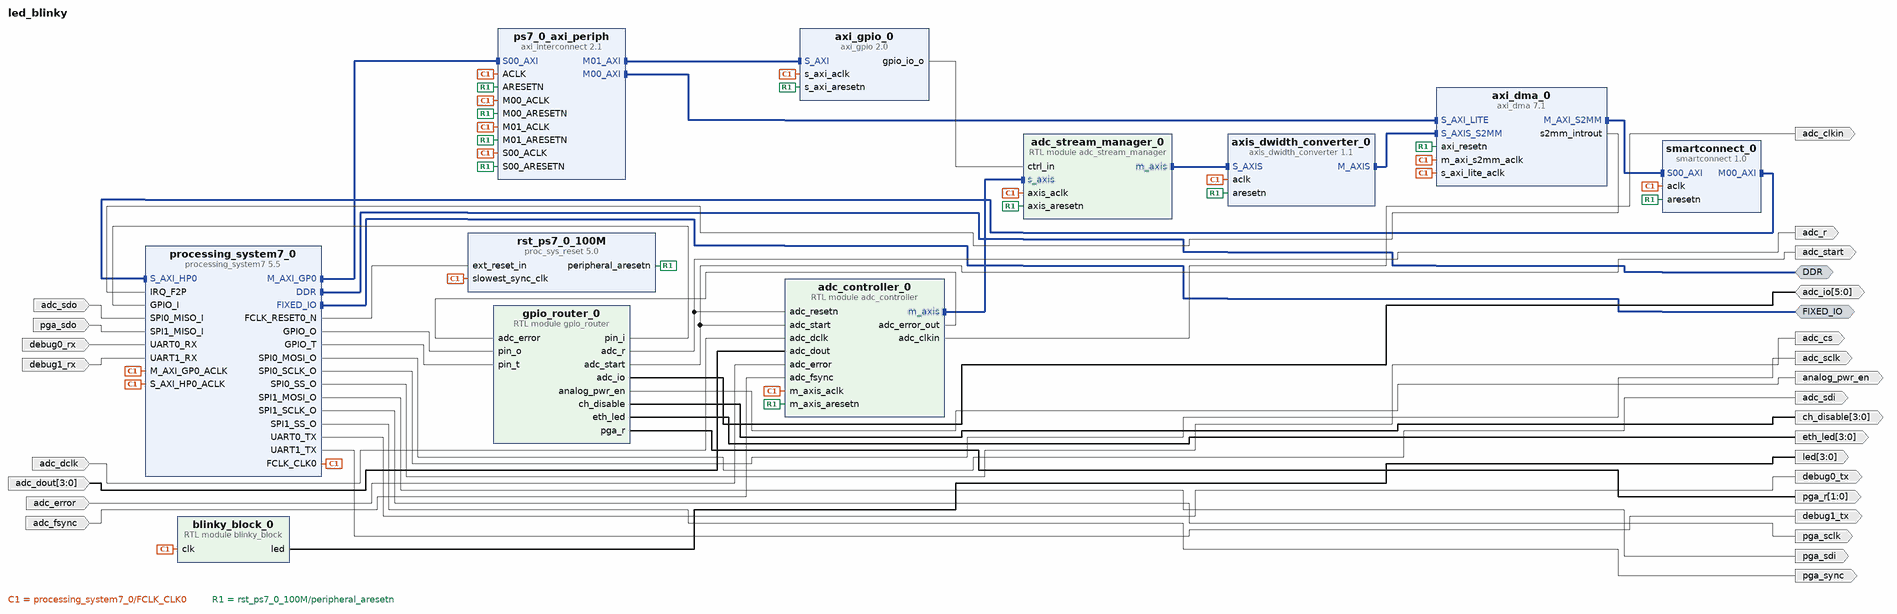
[diagram p0: block diagram of the top level]
# Vivado block design led_blinky, xc7z020clg484-2, Vivado 2022.2
create_bd_design led_blinky

create_bd_intf_port -mode Master -vlnv xilinx.com:interface:ddrx_rtl:1.0 DDR
create_bd_intf_port -mode Master -vlnv xilinx.com:display_processing_system7:fixedio_rtl:1.0 FIXED_IO
create_bd_port -dir O -from 3 -to 0 led
create_bd_port -dir O debug0_tx
create_bd_port -dir I debug0_rx
create_bd_port -dir O debug1_tx
create_bd_port -dir I debug1_rx
create_bd_port -dir O -from 3 -to 0 eth_led
create_bd_port -dir O analog_pwr_en
create_bd_port -dir O -from 3 -to 0 ch_disable
create_bd_port -dir IO -from 5 -to 0 adc_io
create_bd_port -dir O -from 1 -to 0 pga_r
create_bd_port -dir O adc_sclk
create_bd_port -dir O adc_sdi
create_bd_port -dir I adc_sdo
create_bd_port -dir O adc_cs
create_bd_port -dir O pga_sclk
create_bd_port -dir O pga_sdi
create_bd_port -dir I pga_sdo
create_bd_port -dir O pga_sync
create_bd_port -dir O -type clk adc_clkin
create_bd_port -dir O adc_start
create_bd_port -dir O adc_r
create_bd_port -dir I adc_error
create_bd_port -dir I adc_fsync
create_bd_port -dir I -from 3 -to 0 adc_dout
create_bd_port -dir I adc_dclk

create_bd_cell -type module -reference blinky_block blinky_block_0
create_bd_cell -type ip -vlnv xilinx.com:ip:processing_system7:5.5 processing_system7_0
set_property -dict [list \
  CONFIG.PCW_ENET0_ENET0_IO {MIO 16 .. 27} \
  CONFIG.PCW_ENET0_GRP_MDIO_ENABLE 1 \
  CONFIG.PCW_ENET0_GRP_MDIO_IO {MIO 52 .. 53} \
  CONFIG.PCW_ENET0_PERIPHERAL_ENABLE 1 \
  CONFIG.PCW_ENET_RESET_ENABLE 0 \
  CONFIG.PCW_FPGA0_PERIPHERAL_FREQMHZ 100 \
  CONFIG.PCW_GPIO_EMIO_GPIO_ENABLE 1 \
  CONFIG.PCW_GPIO_EMIO_GPIO_IO 64 \
  CONFIG.PCW_GPIO_MIO_GPIO_ENABLE 1 \
  CONFIG.PCW_GPIO_MIO_GPIO_IO MIO \
  CONFIG.PCW_I2C_RESET_ENABLE 0 \
  CONFIG.PCW_IRQ_F2P_INTR 1 \
  CONFIG.PCW_PRESET_BANK1_VOLTAGE {LVCMOS 1.8V} \
  CONFIG.PCW_QSPI_GRP_FBCLK_ENABLE 1 \
  CONFIG.PCW_QSPI_GRP_FBCLK_IO {MIO 8} \
  CONFIG.PCW_QSPI_GRP_SINGLE_SS_ENABLE 1 \
  CONFIG.PCW_QSPI_GRP_SINGLE_SS_IO {MIO 1 .. 6} \
  CONFIG.PCW_QSPI_PERIPHERAL_ENABLE 1 \
  CONFIG.PCW_QSPI_QSPI_IO {MIO 1 .. 6} \
  CONFIG.PCW_SD0_PERIPHERAL_ENABLE 0 \
  CONFIG.PCW_SINGLE_QSPI_DATA_MODE x4 \
  CONFIG.PCW_SPI0_PERIPHERAL_ENABLE 1 \
  CONFIG.PCW_SPI0_SPI0_IO EMIO \
  CONFIG.PCW_SPI1_PERIPHERAL_ENABLE 1 \
  CONFIG.PCW_SPI1_SPI1_IO EMIO \
  CONFIG.PCW_UART0_PERIPHERAL_ENABLE 1 \
  CONFIG.PCW_UART0_UART0_IO EMIO \
  CONFIG.PCW_UART1_PERIPHERAL_ENABLE 1 \
  CONFIG.PCW_UART1_UART1_IO EMIO \
  CONFIG.PCW_UART_PERIPHERAL_FREQMHZ 100 \
  CONFIG.PCW_UIPARAM_DDR_PARTNO {MT41J256M16 RE-125} \
  CONFIG.PCW_USB0_PERIPHERAL_ENABLE 1 \
  CONFIG.PCW_USB0_USB0_IO {MIO 28 .. 39} \
  CONFIG.PCW_USB_RESET_ENABLE 0 \
  CONFIG.PCW_USE_FABRIC_INTERRUPT 1 \
  CONFIG.PCW_USE_S_AXI_HP0 1 \
] [get_bd_cells processing_system7_0]
# 238 more settings of processing_system7_0 are not shown: defaults, MIO pin electricals, DDR timing, and values the tool derives
create_bd_cell -type ip -vlnv xilinx.com:ip:axis_dwidth_converter:1.1 axis_dwidth_converter_0
set_property -dict {CONFIG.M_TDATA_NUM_BYTES 8 CONFIG.S_TDATA_NUM_BYTES 16} [get_bd_cells axis_dwidth_converter_0]
create_bd_cell -type ip -vlnv xilinx.com:ip:axi_interconnect:2.1 ps7_0_axi_periph
set_property -dict {CONFIG.NUM_MI 2} [get_bd_cells ps7_0_axi_periph]
create_bd_cell -type ip -vlnv xilinx.com:ip:smartconnect:1.0 smartconnect_0
set_property -dict {CONFIG.NUM_SI 1} [get_bd_cells smartconnect_0]
create_bd_cell -type ip -vlnv xilinx.com:ip:proc_sys_reset:5.0 rst_ps7_0_100M
create_bd_cell -type module -reference gpio_router gpio_router_0
create_bd_cell -type ip -vlnv xilinx.com:ip:axi_gpio:2.0 axi_gpio_0
set_property -dict {CONFIG.C_ALL_OUTPUTS 1 CONFIG.C_DOUT_DEFAULT 0x00000080 CONFIG.C_GPIO_WIDTH 16} [get_bd_cells axi_gpio_0]
create_bd_cell -type module -reference adc_controller adc_controller_0
create_bd_cell -type module -reference adc_stream_manager adc_stream_manager_0
create_bd_cell -type ip -vlnv xilinx.com:ip:axi_dma:7.1 axi_dma_0
set_property -dict [list \
  CONFIG.c_include_mm2s 0 \
  CONFIG.c_include_sg 0 \
  CONFIG.c_m_axi_s2mm_data_width 64 \
  CONFIG.c_s_axis_s2mm_tdata_width 64 \
] [get_bd_cells axi_dma_0]

# ---- connections ----

connect_bd_intf_net [get_bd_intf_pins adc_stream_manager_0/s_axis] [get_bd_intf_pins adc_controller_0/m_axis]
connect_bd_intf_net [get_bd_intf_pins adc_stream_manager_0/m_axis] [get_bd_intf_pins axis_dwidth_converter_0/S_AXIS]
connect_bd_intf_net [get_bd_intf_pins axi_dma_0/M_AXI_S2MM] [get_bd_intf_pins smartconnect_0/S00_AXI]
connect_bd_intf_net [get_bd_intf_pins axis_dwidth_converter_0/M_AXIS] [get_bd_intf_pins axi_dma_0/S_AXIS_S2MM]
connect_bd_intf_net [get_bd_intf_ports DDR] [get_bd_intf_pins processing_system7_0/DDR]
connect_bd_intf_net [get_bd_intf_ports FIXED_IO] [get_bd_intf_pins processing_system7_0/FIXED_IO]
connect_bd_intf_net [get_bd_intf_pins ps7_0_axi_periph/S00_AXI] [get_bd_intf_pins processing_system7_0/M_AXI_GP0]
connect_bd_intf_net [get_bd_intf_pins ps7_0_axi_periph/M00_AXI] [get_bd_intf_pins axi_dma_0/S_AXI_LITE]
connect_bd_intf_net [get_bd_intf_pins ps7_0_axi_periph/M01_AXI] [get_bd_intf_pins axi_gpio_0/S_AXI]
connect_bd_intf_net [get_bd_intf_pins smartconnect_0/M00_AXI] [get_bd_intf_pins processing_system7_0/S_AXI_HP0]
connect_bd_net -net SPI0_MISO_I_0_1 [get_bd_ports adc_sdo] [get_bd_pins processing_system7_0/SPI0_MISO_I]
connect_bd_net -net SPI1_MISO_I_0_1 [get_bd_ports pga_sdo] [get_bd_pins processing_system7_0/SPI1_MISO_I]
connect_bd_net -net UART0_RX_0_1 [get_bd_ports debug0_rx] [get_bd_pins processing_system7_0/UART0_RX]
connect_bd_net -net UART1_RX_0_1 [get_bd_ports debug1_rx] [get_bd_pins processing_system7_0/UART1_RX]
connect_bd_net [get_bd_pins adc_controller_0/adc_clkin] [get_bd_ports adc_clkin]
connect_bd_net [get_bd_pins adc_controller_0/adc_error_out] [get_bd_pins gpio_router_0/adc_error]
connect_bd_net [get_bd_ports adc_dclk] [get_bd_pins adc_controller_0/adc_dclk]
connect_bd_net -net adc_dout_0_1 [get_bd_ports adc_dout] [get_bd_pins adc_controller_0/adc_dout]
connect_bd_net -net adc_error_0_1 [get_bd_ports adc_error] [get_bd_pins adc_controller_0/adc_error]
connect_bd_net [get_bd_ports adc_fsync] [get_bd_pins adc_controller_0/adc_fsync]
connect_bd_net [get_bd_ports adc_io] [get_bd_pins gpio_router_0/adc_io]
connect_bd_net [get_bd_pins axi_dma_0/s2mm_introut] [get_bd_pins processing_system7_0/IRQ_F2P]
connect_bd_net [get_bd_pins axi_gpio_0/gpio_io_o] [get_bd_pins adc_stream_manager_0/ctrl_in]
connect_bd_net [get_bd_pins blinky_block_0/led] [get_bd_ports led]
connect_bd_net [get_bd_pins gpio_router_0/adc_r] [get_bd_ports adc_r] [get_bd_pins adc_controller_0/adc_resetn]
connect_bd_net [get_bd_pins gpio_router_0/adc_start] [get_bd_ports adc_start] [get_bd_pins adc_controller_0/adc_start]
connect_bd_net [get_bd_pins gpio_router_0/analog_pwr_en] [get_bd_ports analog_pwr_en]
connect_bd_net [get_bd_pins gpio_router_0/ch_disable] [get_bd_ports ch_disable]
connect_bd_net [get_bd_pins gpio_router_0/eth_led] [get_bd_ports eth_led]
connect_bd_net [get_bd_pins gpio_router_0/pga_r] [get_bd_ports pga_r]
connect_bd_net [get_bd_pins gpio_router_0/pin_i] [get_bd_pins processing_system7_0/GPIO_I]
connect_bd_net [get_bd_pins processing_system7_0/FCLK_CLK0] \
  [get_bd_pins blinky_block_0/clk] [get_bd_pins ps7_0_axi_periph/S00_ACLK] [get_bd_pins ps7_0_axi_periph/M00_ACLK] \
  [get_bd_pins ps7_0_axi_periph/ACLK] [get_bd_pins rst_ps7_0_100M/slowest_sync_clk] [get_bd_pins smartconnect_0/aclk] \
  [get_bd_pins processing_system7_0/S_AXI_HP0_ACLK] [get_bd_pins axi_gpio_0/s_axi_aclk] \
  [get_bd_pins ps7_0_axi_periph/M01_ACLK] [get_bd_pins processing_system7_0/M_AXI_GP0_ACLK] \
  [get_bd_pins axis_dwidth_converter_0/aclk] [get_bd_pins adc_controller_0/m_axis_aclk] \
  [get_bd_pins adc_stream_manager_0/axis_aclk] [get_bd_pins axi_dma_0/m_axi_s2mm_aclk] \
  [get_bd_pins axi_dma_0/s_axi_lite_aclk]
connect_bd_net [get_bd_pins processing_system7_0/FCLK_RESET0_N] [get_bd_pins rst_ps7_0_100M/ext_reset_in]
connect_bd_net [get_bd_pins processing_system7_0/GPIO_O] [get_bd_pins gpio_router_0/pin_o]
connect_bd_net [get_bd_pins processing_system7_0/GPIO_T] [get_bd_pins gpio_router_0/pin_t]
connect_bd_net [get_bd_pins processing_system7_0/SPI0_MOSI_O] [get_bd_ports adc_sdi]
connect_bd_net [get_bd_pins processing_system7_0/SPI0_SCLK_O] [get_bd_ports adc_sclk]
connect_bd_net [get_bd_pins processing_system7_0/SPI0_SS_O] [get_bd_ports adc_cs]
connect_bd_net [get_bd_pins processing_system7_0/SPI1_MOSI_O] [get_bd_ports pga_sdi]
connect_bd_net [get_bd_pins processing_system7_0/SPI1_SCLK_O] [get_bd_ports pga_sclk]
connect_bd_net [get_bd_pins processing_system7_0/SPI1_SS_O] [get_bd_ports pga_sync]
connect_bd_net [get_bd_pins processing_system7_0/UART0_TX] [get_bd_ports debug0_tx]
connect_bd_net [get_bd_pins processing_system7_0/UART1_TX] [get_bd_ports debug1_tx]
connect_bd_net [get_bd_pins rst_ps7_0_100M/peripheral_aresetn] \
  [get_bd_pins ps7_0_axi_periph/S00_ARESETN] [get_bd_pins ps7_0_axi_periph/M00_ARESETN] \
  [get_bd_pins ps7_0_axi_periph/ARESETN] [get_bd_pins smartconnect_0/aresetn] [get_bd_pins axi_gpio_0/s_axi_aresetn] \
  [get_bd_pins ps7_0_axi_periph/M01_ARESETN] [get_bd_pins axis_dwidth_converter_0/aresetn] \
  [get_bd_pins adc_controller_0/m_axis_aresetn] [get_bd_pins adc_stream_manager_0/axis_aresetn] \
  [get_bd_pins axi_dma_0/axi_resetn]

# ---- address map ----
assign_bd_address -offset 0x00000000 -range 1G -target_address_space [get_bd_addr_spaces axi_dma_0/Data_S2MM] [get_bd_addr_segs processing_system7_0/S_AXI_HP0/HP0_DDR_LOWOCM]
assign_bd_address -offset 0x40400000 -range 64K -target_address_space [get_bd_addr_spaces processing_system7_0/Data] [get_bd_addr_segs axi_dma_0/S_AXI_LITE/Reg]
assign_bd_address -offset 0x41200000 -range 64K -target_address_space [get_bd_addr_spaces processing_system7_0/Data] [get_bd_addr_segs axi_gpio_0/S_AXI/Reg]

validate_bd_design
save_bd_design
